# Altium schematic sheet Sheet7.SchDoc
size A4; SheetNumber: 6; SheetTotal: 6
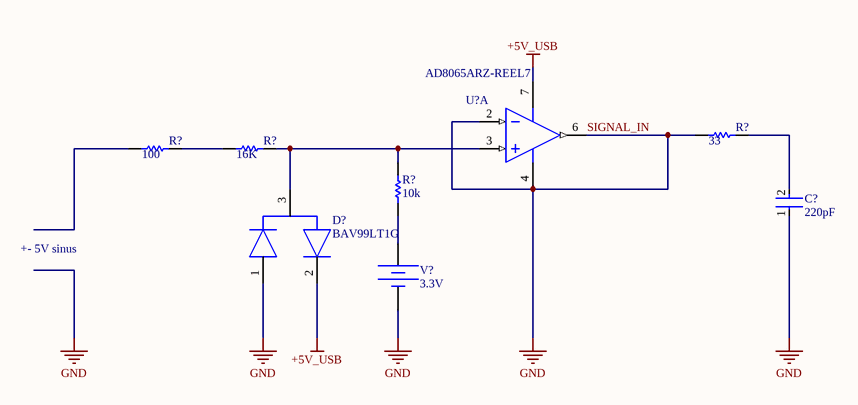
[diagram p0: Sheet7.SchDoc]

## Parts
(Parts that share a designator on the sheet are numbered #1, #2 ... from top to bottom, then left to right.)
C?  220pF  [FP-CC0402-0_05-0_55-L2_0-MFG]
D?  BAV99LT1G  [FP-318-08-IPC_B]
R?#1  33  [RESC1005X40X25NL05T10]
R?#2  100  [RESC1005X40X25NL05T10]
R?#3  16K  [RESC1005X40X25NL05T10]
R?#4  10k  [RESC1005X40X25NL05T10]
U?  AD8065ARZ-REEL7  [ADI-R-8_M]  (part A of 2)
V?  DC Magnitude: 3.3V  (hidden comment: Constant Voltage Source)

## Nets
+5V_USB: D?.2(C) U?.7(+VS)
SIGNAL_IN: C?.1 D?.1(A) R?#1.1 U?.2(-IN) U?.4(-VS) U?.6(VOUT) V?.2  [also labelled GND]
NetC?_2: C?.2 R?#1.2
NetD?_3: D?.3(CATHODE/ANODE) R?#3.2 R?#4.2 U?.3(+IN)
NetR?#2_2: R?#2.2 R?#3.1
NetR?#4_1: R?#4.1 V?.1

Not connected (* = marked no-connect by the designer): R?#2 1

## Notes on the sheet
- +- 5V sinus

## Library data of the parts
C? = CAP CER 0.1UF 16V X7R 0402: Tolerance: 5%; Capacitance: 100nF; Lead Free: Lead Free; Halogen Free: Halogen Free; Voltage Rating (DC): 16V; Thickness: 0.022inch; Resistor Type: Ceramic; Min Operating Temperature: -55°C; Width: 0.02inch; Voltage Rating: 16V; Package Quantity: 10000; Case/Package: 0402; Height: 0.5mm; Dielectric: X7R; Length: 1mm; Construction: Flat; Radiation Hardening: No; Case Code (Metric): 1005; Case Code (Imperial): 0402; Series: CC; Depth: 0.5mm; RoHS Compliant: Yes; Packaging: Tape and Reel; Mount: Surface Mount; Max Operating Temperature: 125°C
D? = CMP-07163-000036-1: DIODE ARRAY 100V 215MA SOT23-3; Capacitance: 1.5pF; Current Rating: 200mA; Max Repetitive Reverse Voltage (Vrrm): 70V; Forward Voltage: 1.25V; Max Forward Surge Current (Ifsm): 500mA; Peak Reverse Current: 2.5uA; Forward Current: 150mA; Peak Non-Repetitive Surge Current: 2A; Reverse Recovery Time: 6ns; Length: 2.9mm; Voltage Rating (DC): 70V; Case/Package: SOT-23; Height: 0.94mm; Number of Pins: 3; Mount: Surface Mount; Min Operating Temperature: -65°C; Lead Free: Lead Free; REACH SVHC: No SVHC; Width: 1.3mm; Packaging: Tape and Reel; Max Operating Temperature: 150°C
R?#1-R?#4 = 5.1K %1: Part Number: RC0402FR-075K1L; Manufacturer: Yageo / Phycomp
U? = ADI-AD8XX-X8: Single Channel Low Power Operational Amplifier, 145 MHz BW, 180 V/us SR, Industrial, 8-pin SOIC (R-8), Reel; Manufacturer: Analog Devices; Generic Part Number: AD8065; V Span Max: 24V; Input Bias Current: 2pA; V Span Min: 5V; Small Signal Bandwidth: 145MHz; Input Offset Voltage: 400uV; Iq/Amp: 7.4mA; Amplifiers Per Package: 1; Automotive Qualified: Yes; PartNumber: AD8065ARZ-REEL7; ComponentLink1URL: http://www.analog.com/en/index.html; PackageVersion: 060506-A; DatasheetVersion: Rev. J; ComponentLink4URL: http://www.analog.com/en/all-operational-amplifiers-op-amps/operational-amplifiers-op-amps/ad8065/products/product.html#product-recommendations; ComponentLink2URL: http://www.analog.com/static/imported-files/data_sheets/AD8065_8066.pdf; PackageDescription: 8-Pin Standard Small Outline Package, Body 3.9 x 4.9 mm, Pitch 1.27 mm; ComponentLink2Description: Datasheet; ComponentLink1Description: Manufacturer URL; Mounting Technology: Surface Mount; PackageReference: R-8; ComponentLink3Description: Package Specification; Slew Rate: 180V/us; RevisionNote: Reference Circuit URL fixed; ComponentLink4Description: Reference Circuit; Code_JEDEC: MS-012-AA; ComponentLink3URL: http://www.analog.com/static/imported-files/packages/PKG_PDF/SOIC_Narrow%20(R)/R_8.pdf
V? = Battery: SimulationGenericComponent: True